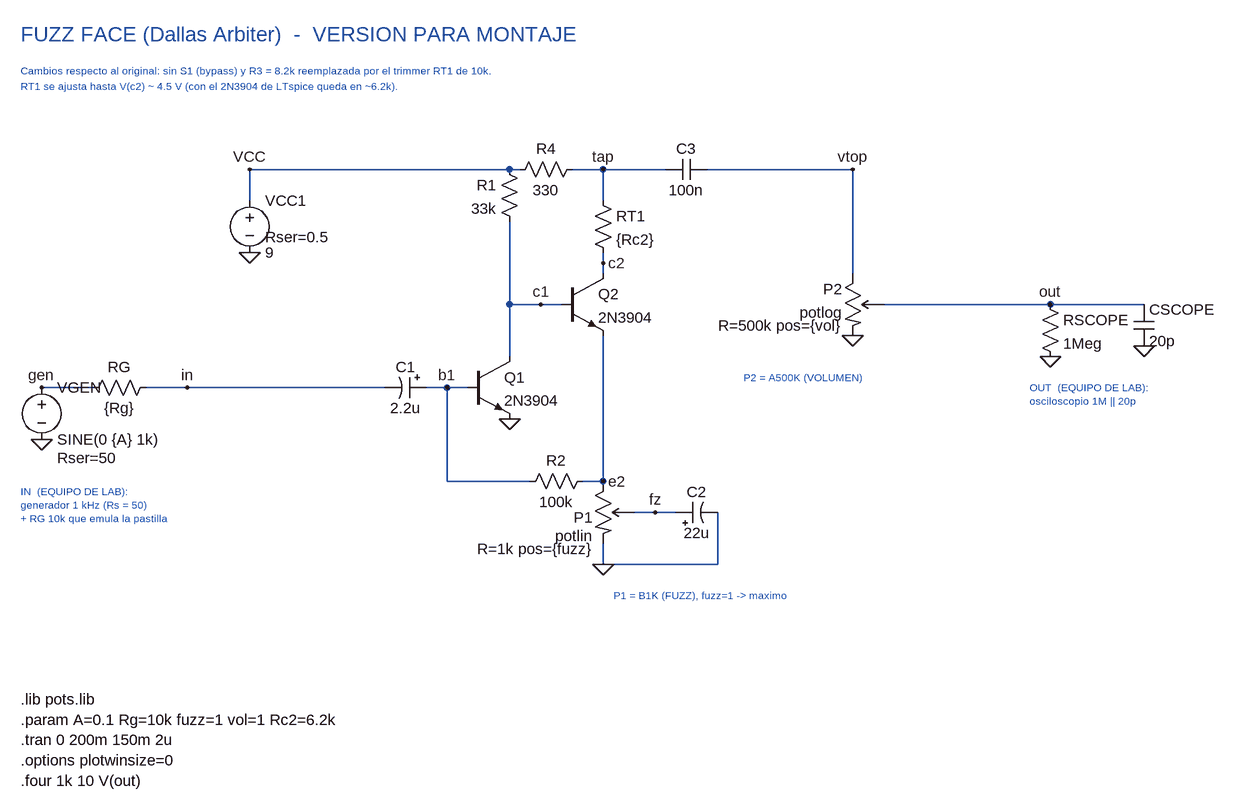
[diagram p0: schematic FuzzFace.asc]
FuzzFace.asc, the LTspice schematic file:
Version 4
SHEET 1 2000 1200
FLAG 0 128 0
WIRE 0 48 0 0
WIRE 0 0 400 0
FLAG 0 0 VCC
WIRE 400 0 416 0
WIRE 496 0 544 0
FLAG 544 0 tap
WIRE 544 0 544 48
WIRE 544 0 640 0
WIRE 704 0 928 0
FLAG 928 0 vtop
WIRE 544 128 544 144
WIRE 544 144 544 160
FLAG 544 144 c2
WIRE 400 80 400 208
WIRE 400 208 448 208
WIRE 448 208 480 208
FLAG 448 208 c1
WIRE 400 288 400 208
FLAG 400 384 0
FLAG -320 416 0
FLAG -320 336 gen
WIRE -320 336 -240 336
WIRE -160 336 -96 336
FLAG -96 336 in
WIRE -96 336 96 336
WIRE 96 336 208 336
WIRE 272 336 304 336
WIRE 304 336 336 336
FLAG 304 336 b1
WIRE 304 336 304 480
WIRE 304 480 432 480
WIRE 512 480 544 480
WIRE 544 256 544 480
FLAG 544 480 e2
WIRE 592 528 624 528
WIRE 624 528 656 528
FLAG 624 528 fz
WIRE 720 528 720 608
WIRE 720 608 544 608
WIRE 544 576 544 608
FLAG 544 608 0
WIRE 928 0 928 160
FLAG 928 256 0
WIRE 976 208 1168 208
WIRE 1168 208 1232 208
FLAG 1232 208 out
WIRE 1232 208 1376 208
FLAG 1232 288 0
FLAG 1376 272 0
TEXT -352 -208 Left 3 ;FUZZ FACE (Dallas Arbiter)  -  VERSION PARA MONTAJE
TEXT -352 -152 Left 1 ;Cambios respecto al original: sin S1 (bypass) y R3 = 8.2k reemplazada por el trimmer RT1 de 10k.
TEXT -352 -128 Left 1 ;RT1 se ajusta hasta V(c2) ~ 4.5 V (con el 2N3904 de LTspice queda en ~6.2k).
TEXT -352 496 Left 1 ;IN  (EQUIPO DE LAB):\ngenerador 1 kHz (Rs = 50)\n+ RG 10k que emula la pastilla
TEXT 1200 336 Left 1 ;OUT  (EQUIPO DE LAB):\nosciloscopio 1M || 20p
TEXT 760 320 Left 1 ;P2 = A500K (VOLUMEN)
TEXT 560 656 Left 1 ;P1 = B1K (FUZZ), fuzz=1 -> maximo
TEXT -352 816 Left 2 !.lib pots.lib\n.param A=0.1 Rg=10k fuzz=1 vol=1 Rc2=6.2k\n.tran 0 200m 150m 2u\n.options plotwinsize=0\n.four 1k 10 V(out)
SYMBOL voltage 0 32 R0
WINDOW 123 0 0 Left 0
WINDOW 39 24 72 Left 2
SYMATTR InstName VCC1
SYMATTR Value 9
SYMATTR SpiceLine Rser=0.5
SYMBOL res 384 -16 R0
WINDOW 0 -4 40 Right 2
WINDOW 3 -4 76 Right 2
SYMATTR InstName R1
SYMATTR Value 33k
SYMBOL res 512 -16 R90
WINDOW 0 0 56 VBottom 2
WINDOW 3 32 56 VTop 2
SYMATTR InstName R4
SYMATTR Value 330
SYMBOL res 528 32 R0
SYMATTR InstName RT1
SYMATTR Value {Rc2}
SYMBOL cap 704 -16 R90
WINDOW 0 0 32 VBottom 2
WINDOW 3 32 32 VTop 2
SYMATTR InstName C3
SYMATTR Value 100n
SYMBOL npn 480 160 R0
SYMATTR InstName Q2
SYMATTR Value 2N3904
SYMBOL npn 336 288 R0
SYMATTR InstName Q1
SYMATTR Value 2N3904
SYMBOL voltage -320 320 R0
WINDOW 123 0 0 Left 0
WINDOW 39 24 124 Left 2
SYMATTR InstName VGEN
SYMATTR Value SINE(0 {A} 1k)
SYMATTR SpiceLine Rser=50
SYMBOL res -144 320 R90
WINDOW 0 0 56 VBottom 2
WINDOW 3 32 56 VTop 2
SYMATTR InstName RG
SYMATTR Value {Rg}
SYMBOL polcap 272 320 R90
WINDOW 0 0 32 VBottom 2
WINDOW 3 32 32 VTop 2
SYMATTR InstName C1
SYMATTR Value 2.2u
SYMBOL res 528 464 R90
WINDOW 0 0 56 VBottom 2
WINDOW 3 32 56 VTop 2
SYMATTR InstName R2
SYMATTR Value 100k
SYMBOL pot 544 480 R0
WINDOW 0 -16 56 Right 2
WINDOW 3 -16 84 Right 2
WINDOW 39 -16 104 Right 2
SYMATTR InstName P1
SYMATTR Value potlin
SYMATTR SpiceLine R=1k pos={fuzz}
SYMBOL polcap 656 544 R270
WINDOW 0 32 32 VTop 2
WINDOW 3 0 32 VBottom 2
SYMATTR InstName C2
SYMATTR Value 22u
SYMBOL pot 928 160 R0
WINDOW 0 -16 24 Right 2
WINDOW 3 -16 60 Right 2
WINDOW 39 -16 80 Right 2
SYMATTR InstName P2
SYMATTR Value potlog
SYMATTR SpiceLine R=500k pos={vol}
SYMBOL res 1216 192 R0
SYMATTR InstName RSCOPE
SYMATTR Value 1Meg
SYMBOL cap 1360 208 R0
SYMATTR InstName CSCOPE
SYMATTR Value 20p

The netlist it stands for:
* FuzzFace.asc
VCC1 VCC 0 9 Rser=0.5
R1 VCC c1 33k
R4 tap VCC 330
RT1 tap c2 {Rc2}
C3 vtop tap 100n
Q2 c2 c1 e2 0 2N3904
Q1 c1 b1 0 0 2N3904
VGEN gen 0 SINE(0 {A} 1k) Rser=50
RG in gen {Rg}
C1 b1 in 2.2u
R2 e2 b1 100k
XP1 e2 fz 0 potlin R=1k pos={fuzz}  ; pins 1 W 3
C2 fz 0 22u
XP2 vtop out 0 potlog R=500k pos={vol}  ; pins 1 W 3
RSCOPE out 0 1Meg
CSCOPE out 0 20p
.model NPN NPN
.model PNP PNP
.lib standard.bjt
* FUZZ FACE (Dallas Arbiter)  -  VERSION PARA MONTAJE
* Cambios respecto al original: sin S1 (bypass) y R3 = 8.2k reemplazada por el trimmer RT1 de 10k.
* RT1 se ajusta hasta V(c2) ~ 4.5 V (con el 2N3904 de LTspice queda en ~6.2k).
* IN  (EQUIPO DE LAB):
* generador 1 kHz (Rs = 50)
* + RG 10k que emula la pastilla
* OUT  (EQUIPO DE LAB):
* osciloscopio 1M || 20p
* P2 = A500K (VOLUMEN)
* P1 = B1K (FUZZ), fuzz=1 -> maximo
.lib pots.lib
.param A=0.1 Rg=10k fuzz=1 vol=1 Rc2=6.2k
.tran 0 200m 150m 2u
.options plotwinsize=0
.four 1k 10 V(out)
.backanno
.end